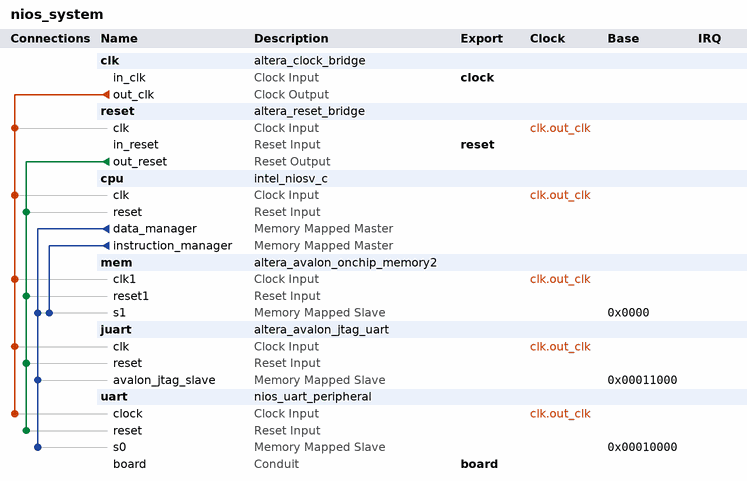
[diagram p0: system contents]
# Platform Designer (Qsys) system nios_system, Cyclone IV E EP4CE115F29C7
# Parameters at their usual value, and those the tool derives, are not listed.
package require -exact qsys 25.1
create_system nios_system
set_project_property DEVICE_FAMILY {Cyclone IV E}
set_project_property DEVICE EP4CE115F29C7

add_instance clk altera_clock_bridge 25.1
set_instance_parameter_value clk DERIVED_CLOCK_RATE 0
set_instance_parameter_value clk EXPLICIT_CLOCK_RATE 50000000

add_instance reset altera_reset_bridge 25.1
set_instance_parameter_value reset ACTIVE_LOW_RESET 1
set_instance_parameter_value reset SYNCHRONOUS_EDGES deassert

add_instance cpu intel_niosv_c 4.1.0
set_instance_parameter_value cpu archSize 32
set_instance_parameter_value cpu clockFrequency 50000000
set_instance_parameter_value cpu enableAvalonInterface true
set_instance_parameter_value cpu enableECCLite false
set_instance_parameter_value cpu enableResetReq false
set_instance_parameter_value cpu hartID 0
set_instance_parameter_value cpu numGpr 32
set_instance_parameter_value cpu resetOffset 0
set_instance_parameter_value cpu resetSlave Absolute
set_instance_parameter_value cpu useResetReq false

add_instance mem altera_avalon_onchip_memory2 25.1
set_instance_parameter_value mem dataWidth 32
set_instance_parameter_value mem dualPort false
set_instance_parameter_value mem initMemContent true
set_instance_parameter_value mem initializationFileName firmware.mif
set_instance_parameter_value mem memorySize 65536

add_instance juart altera_avalon_jtag_uart 25.1
set_instance_parameter_value juart readBufferDepth 512
set_instance_parameter_value juart simInteractiveOptions NO_INTERACTIVE_WINDOWS
set_instance_parameter_value juart writeBufferDepth 512

add_instance uart nios_uart_peripheral 1.0

# connections
add_connection clk.out_clk cpu.clk clock
add_connection clk.out_clk juart.clk clock
add_connection clk.out_clk mem.clk1 clock
add_connection clk.out_clk reset.clk clock
add_connection clk.out_clk uart.clock clock
add_connection reset.out_reset cpu.reset reset
add_connection reset.out_reset juart.reset reset
add_connection reset.out_reset mem.reset1 reset
add_connection reset.out_reset uart.reset reset
add_connection cpu.data_manager juart.avalon_jtag_slave avalon
set_connection_parameter_value cpu.data_manager/juart.avalon_jtag_slave baseAddress 0x00011000
add_connection cpu.data_manager mem.s1 avalon
set_connection_parameter_value cpu.data_manager/mem.s1 baseAddress 0x0000
add_connection cpu.data_manager uart.s0 avalon
set_connection_parameter_value cpu.data_manager/uart.s0 baseAddress 0x00010000
add_connection cpu.instruction_manager mem.s1 avalon
set_connection_parameter_value cpu.instruction_manager/mem.s1 baseAddress 0x0000

# exported interfaces
add_interface board conduit end
set_interface_property board EXPORT_OF uart.board
add_interface clock clock sink
set_interface_property clock EXPORT_OF clk.in_clk
add_interface reset reset sink
set_interface_property reset EXPORT_OF reset.in_reset

set_interconnect_requirement {$system} qsys_mm.clockCrossingAdapter HANDSHAKE
set_interconnect_requirement {$system} qsys_mm.enableEccProtection FALSE
set_interconnect_requirement {$system} qsys_mm.insertDefaultSlave FALSE
set_interconnect_requirement {$system} qsys_mm.maxAdditionalLatency 1

save_system nios_system.qsys
